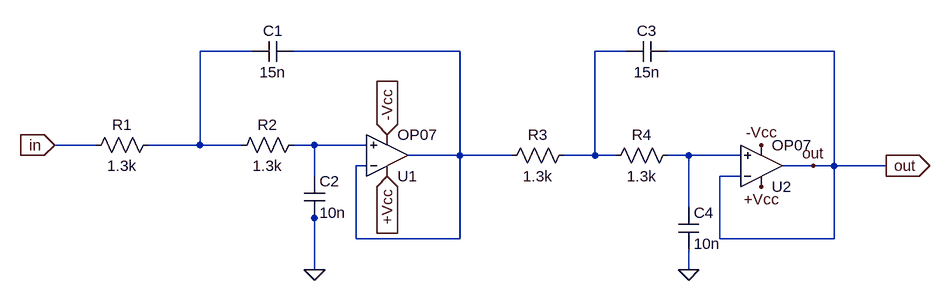
[diagram p0: schematic Low_Pass_updated.asc]
Low_Pass_updated.asc, the LTspice schematic file:
Version 4.1
SHEET 1 1668 680
WIRE 48 -880 -32 -880
WIRE 368 -880 112 -880
WIRE 624 -880 576 -880
WIRE 944 -880 688 -880
WIRE -192 -736 -256 -736
WIRE -32 -736 -32 -880
WIRE -32 -736 -112 -736
WIRE 32 -736 -32 -736
WIRE 144 -736 112 -736
WIRE 224 -736 144 -736
WIRE 368 -720 368 -880
WIRE 368 -720 288 -720
WIRE 448 -720 368 -720
WIRE 576 -720 576 -880
WIRE 576 -720 528 -720
WIRE 608 -720 576 -720
WIRE 720 -720 688 -720
WIRE 800 -720 720 -720
WIRE 224 -704 208 -704
WIRE 912 -704 864 -704
WIRE 944 -704 944 -880
WIRE 944 -704 912 -704
WIRE 1024 -704 944 -704
WIRE 144 -688 144 -736
WIRE 800 -688 768 -688
WIRE 720 -640 720 -720
WIRE 144 -624 144 -640
WIRE 208 -592 208 -704
WIRE 368 -592 368 -720
WIRE 368 -592 208 -592
WIRE 768 -592 768 -688
WIRE 944 -592 944 -704
WIRE 944 -592 768 -592
WIRE 144 -544 144 -624
WIRE 720 -544 720 -576
FLAG 144 -544 0
FLAG 720 -544 0
FLAG 912 -704 out
FLAG 256 -688 +Vcc
IOPIN 256 -688 In
FLAG 832 -672 +Vcc
FLAG 256 -752 -Vcc
IOPIN 256 -752 In
FLAG 832 -736 -Vcc
FLAG -256 -736 in
IOPIN -256 -736 In
FLAG 1024 -704 out
IOPIN 1024 -704 Out
SYMBOL cap 112 -896 R90
WINDOW 0 0 32 VBottom 2
WINDOW 3 32 32 VTop 2
SYMATTR InstName C1
SYMATTR Value 15n
SYMBOL cap 128 -688 R0
SYMATTR InstName C2
SYMATTR Value 10n
SYMBOL res -96 -752 R90
WINDOW 0 0 56 VBottom 2
WINDOW 3 32 56 VTop 2
SYMATTR InstName R1
SYMATTR Value 1.3k
SYMBOL res 128 -752 R90
WINDOW 0 0 56 VBottom 2
WINDOW 3 32 56 VTop 2
SYMATTR InstName R2
SYMATTR Value 1.3k
SYMBOL OpAmps\\OP07 256 -656 M180
SYMATTR InstName U1
SYMBOL cap 688 -896 R90
WINDOW 0 0 32 VBottom 2
WINDOW 3 32 32 VTop 2
SYMATTR InstName C3
SYMATTR Value 15n
SYMBOL cap 704 -640 R0
SYMATTR InstName C4
SYMATTR Value 10n
SYMBOL res 544 -736 R90
WINDOW 0 0 56 VBottom 2
WINDOW 3 32 56 VTop 2
SYMATTR InstName R3
SYMATTR Value 1.3k
SYMBOL res 704 -736 R90
WINDOW 0 0 56 VBottom 2
WINDOW 3 32 56 VTop 2
SYMATTR InstName R4
SYMATTR Value 1.3k
SYMBOL OpAmps\\OP07 832 -640 M180
SYMATTR InstName U2

The netlist it stands for:
* Low_Pass_updated.asc
C1 N002 N001 15n
C2 N004 0 10n
R1 N001 in 1.3k
R2 N004 N001 1.3k
X§U1 N004 N002 +Vcc -Vcc N002 LT1001  ; OP07, pins In+ In- V+ V- OUT
C3 out N003 15n
C4 N005 0 10n
R3 N003 N002 1.3k
R4 N005 N003 1.3k
X§U2 N005 out +Vcc -Vcc out LT1001  ; OP07, pins In+ In- V+ V- OUT
.lib LTC.lib
.backanno
.end